# EAGLE design source_eagle (EAGLE 9.1.2)
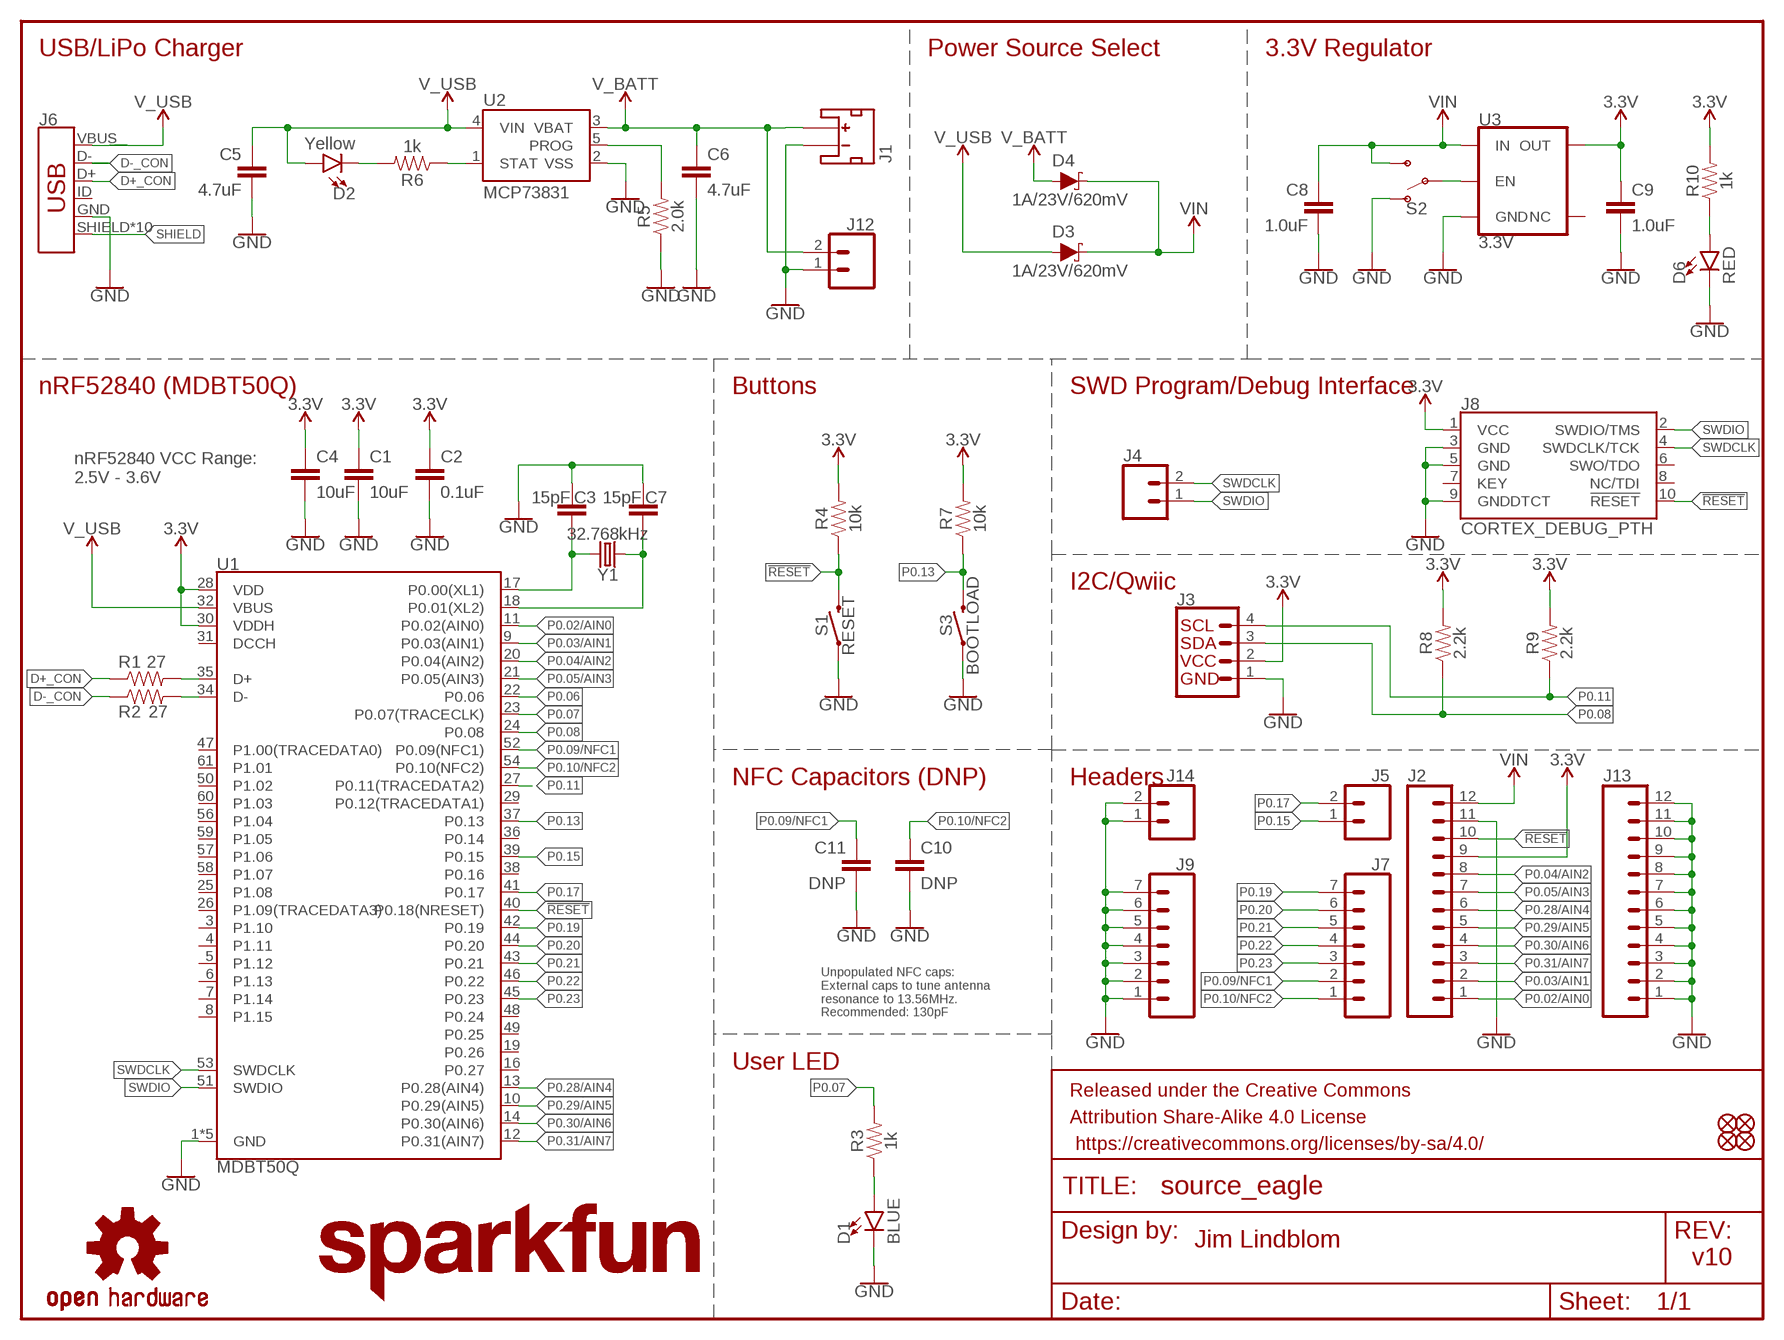
[diagram p0: schematic, sheet 1]

## Parts
C1  10uF  10UF-0603-6.3V-20%  [0603]
C2  0.1uF  0.1UF-0603-25V-(+80/-20%)  [0603]
C3  15pF  15PF-0603-50V-5%  [0603]
C4  10uF  10UF-0603-6.3V-20%  [0603]
C5  4.7uF  4.7UF-0603-6.3V-(10%)  [0603]
C6  4.7uF  4.7UF-0603-6.3V-(10%)  [0603]
C7  15pF  15PF-0603-50V-5%  [0603]
C8  1.0uF  1.0UF-0603-16V-10%  [0603]
C9  1.0uF  1.0UF-0603-16V-10%  [0603]
C10  DNP  270PF-0603-50V-5%  [0603]
C11  DNP  270PF-0603-50V-5%  [0603]
D1  BLUE  LED-BLUE0603  [LED-0603]
D2  Yellow  LED-YELLOW0603  [LED-0603]
D3  1A/23V/620mV  DIODE-SCHOTTKY-BAT20J  [SOD-323]
D4  1A/23V/620mV  DIODE-SCHOTTKY-BAT20J  [SOD-323]
D6  RED  LED-RED0603  [LED-0603]
FD1  FIDUCIALUFIDUCIAL  [FIDUCIAL-MICRO]
FD2  FIDUCIALUFIDUCIAL  [FIDUCIAL-MICRO]
FD3  FIDUCIALUFIDUCIAL  [FIDUCIAL-MICRO]
FD4  FIDUCIALUFIDUCIAL  [FIDUCIAL-MICRO]
FRAME1  FRAME-LETTER  [CREATIVE_COMMONS]
J1  JST_2MM_MALESMD  [JST-2-SMD]
J2  CONN_12NO_SILK  [1X12_NO_SILK]
J3  QWIIC_CONNECTORJS-1MM  [1X04_1MM_RA]
J4  CONN_021X02_NO_SILK  [1X02_NO_SILK]
J5  CONN_021X02_NO_SILK  [1X02_NO_SILK]
J6  USB_MICRO-B_HALF_PTH_MILL  [USB-MICROB-PTH-MILL]
J7  CONN_07NO_SILK  [1X07_NO_SILK]
J8  CORTEX_DEBUG_PTH  [2X5-PTH-1.27MM]
J9  CONN_07NO_SILK  [1X07_NO_SILK]
J12  CONN_021X02_NO_SILK  [1X02_NO_SILK]
J13  CONN_12NO_SILK  [1X12_NO_SILK]
J14  CONN_021X02_NO_SILK  [1X02_NO_SILK]
LOGO1  SFE_LOGO_NAME.2_INCH  [SFE_LOGO_NAME_.2]
LOGO2  OSHW-LOGOS  [OSHW-LOGO-S]
R1  27  27OHM-0603-1/10W-1%  [0603]
R2  27  27OHM-0603-1/10W-1%  [0603]
R3  1k  1KOHM-0603-1/10W-1%  [0603]
R4  10k  10KOHM-0603-1/10W-1%  [0603]
R5  2.0k  2.0KOHM-0603-1/10W-5%  [0603]
R6  1k  1KOHM-0603-1/10W-1%  [0603]
R7  10k  10KOHM-0603-1/10W-1%  [0603]
R8  2.2k  2.2KOHM-0603-1/10W-1%  [0603]
R9  2.2k  2.2KOHM-0603-1/10W-1%  [0603]
R10  1k  1KOHM-0603-1/10W-1%  [0603]
S1  RESET  MOMENTARY-SWITCH-SPST-SMD-RIGHT-ANGLE  [TACTILE_SWITCH_SMD_RIGHT_ANGLE]
S2  SWITCH-SPDT-SMD-RIGHT-ANGLE  [SWITCH_SPST_SMD_A]
S3  BOOTLOAD  MOMENTARY-SWITCH-SPST-SMD-RIGHT-ANGLE  [TACTILE_SWITCH_SMD_RIGHT_ANGLE]
U1  MDBT50Q  [MDBT50Q]
U2  MCP73831  [SOT23-5]
U3  3.3V  V_REG_AP2112K-3.3V  [SOT23-5]
Y1  32.768kHz  CRYSTAL-32.768KHZSMD-3.2X1.5  [CRYSTAL-SMD-3.2X1.5MM]

## Nets
3.3V [vcc]: C1.1 C2.1 C4.1 C9.1 J2.9 J3.2 J8.1(VCC) R4.2 R7.2 R8.2 R9.2 R10.2 U1.28(VDD) U1.30(VDDH) U3.5(OUT)
!RESET: J2.10 J8.10(!RESET) R4.1 S1.2 U1.40(P0.18(NRESET))
D+ [usb]: R1.2 U1.35(D+)
D+_CON [usb]: J6.D+ R1.1
D- [usb]: R2.2 U1.34(D-)
D-_CON [usb]: J6.D- R2.1
GND: C1.2 C2.2 C3.1 C4.2 C5.2 C6.2 C7.1 C8.2 C9.2 C10.2 C11.2 D1.C D6.C J1.1(-) J2.11 J3.1 J6.GND J8.3(GND) J8.5(GND) J8.9(GNDDTCT) J9.1 J9.2 J9.3 J9.4 J9.5 J9.6 J9.7 J12.1 J13.1 J13.2 J13.3 J13.4 J13.5 J13.6 J13.7 J13.8 J13.9 J13.10 J13.11 J13.12 J14.1 J14.2 R5.1 S1.1 S2.1(O) S3.1 U1.1(GND) U1.2(GND) U1.15(GND) U1.33(GND) U1.55(GND) U2.2(VSS) U3.2(GND)
N$1: R5.2 U2.5(PROG)
N$3: D2.C R6.2
N$4: R6.1 U2.1(STAT)
N$7: D1.A R3.1
N$10: D6.A R10.1
P0.02/AIN0: J2.1 U1.11(P0.02(AIN0))
P0.03/AIN1: J2.2 U1.9(P0.03(AIN1))
P0.04/AIN2: J2.8 U1.20(P0.04(AIN2))
P0.05/AIN3: J2.7 U1.21(P0.05(AIN3))
P0.06: U1.22(P0.06)
P0.07: R3.2 U1.23(P0.07(TRACECLK))
P0.08: J3.3 R8.1 U1.24(P0.08)
P0.09/NFC1: C11.1 J7.2 U1.52(P0.09(NFC1))
P0.10/NFC2: C10.1 J7.1 U1.54(P0.10(NFC2))
P0.11: J3.4 R9.1 U1.27(P0.11(TRACEDATA2))
P0.13: R7.1 S3.2 U1.37(P0.13)
P0.15: J5.1 U1.39(P0.15)
P0.17: J5.2 U1.41(P0.17)
P0.19: J7.7 U1.42(P0.19)
P0.20: J7.6 U1.44(P0.20)
P0.21: J7.5 U1.43(P0.21)
P0.22: J7.4 U1.46(P0.22)
P0.23: J7.3 U1.45(P0.23)
P0.28/AIN4: J2.6 U1.13(P0.28(AIN4))
P0.29/AIN5: J2.5 U1.10(P0.29(AIN5))
P0.30/AIN6: J2.4 U1.14(P0.30(AIN6))
P0.31/AIN7: J2.3 U1.12(P0.31(AIN7))
SHIELD: J6.SHIELD J6.SHIELD2(SHIELD) J6.SHIELD3(SHIELD) J6.SHIELD4(SHIELD) J6.SHIELD5(SHIELD) J6.SHIELD6(SHIELD) J6.SHIELD7(SHIELD) J6.SHIELD8(SHIELD) J6.SHIELD9(SHIELD) J6.SHIELD10(SHIELD)
SWDCLK: J4.2 J8.4(SWDCLK/TCK) U1.53(SWDCLK)
SWDIO: J4.1 J8.2(SWDIO/TMS) U1.51(SWDIO)
V_BATT: C6.1 D4.A J1.2(+) J12.2 U2.3(VBAT)
V_USB: C5.1 D2.A D3.A J6.VBUS U1.32(VBUS) U2.4(VIN)
VIN [vcc]: C8.1 D3.C D4.C J2.12 S2.3(S) U3.1(IN)
VREG_EN: S2.2(P) U3.3(EN)
XL1: C3.2 U1.17(P0.00(XL1)) Y1.P$2
XL2: C7.2 U1.18(P0.01(XL2)) Y1.P$1
Unconnected: J6.ID J8.6(SWO/TDO) J8.7(KEY) J8.8(NC/TDI) U1.3(P1.10) U1.4(P1.11) U1.5(P1.12) U1.6(P1.13) U1.7(P1.14) U1.8(P1.15) U1.16(P0.27) U1.19(P0.26) U1.25(P1.08) U1.26(P1.09(TRACEDATA3)) U1.29(P0.12(TRACEDATA1)) U1.31(DCCH) U1.36(P0.14) U1.38(P0.16) U1.47(P1.00(TRACEDATA0)) U1.48(P0.24) U1.49(P0.25) U1.50(P1.02) U1.56(P1.04) U1.57(P1.06) U1.58(P1.07) U1.59(P1.05) U1.60(P1.03) U1.61(P1.01) U3.4(NC)

## Notes on the sheet
- USB/LiPo Charger | Power Source Select | 3.3V Regulator
- nRF52840 (MDBT50Q) | Buttons | SWD Program/Debug Interface
- nRF52840 VCC Range:
  2.5V - 3.6V
- I2C/Qwiic
- NFC Capacitors (DNP) | Headers
- Unpopulated NFC caps:
  External caps to tune antenna 
  resonance to 13.56MHz.
  Recommended: 130pF
- User LED
- Jim Lindblom
- v10

## Library data of the parts
C1 C4 = SparkFun-Capacitors:10UF: 10.0µF ceramic capacitors A capacitor is a passive two-terminal electrical component used to store electrical energy temporarily in an electric field.; PROD_ID: CAP-11015
C2 = SparkFun-Capacitors:0.1UF: 0.1µF ceramic capacitors A capacitor is a passive two-terminal electrical component used to store electrical energy temporarily in an electric field.; PROD_ID: CAP-00810
C3 C7 = SparkFun-Capacitors:15PF: 15pF ceramic capacitors A capacitor is a passive two-terminal electrical component used to store electrical energy temporarily in an electric field.; PROD_ID: CAP-07881
C5 C6 = SparkFun-Capacitors:4.7UF: 4.7µF ceramic capacitors A capacitor is a passive two-terminal electrical component used to store electrical energy temporarily in an electric field.; PROD_ID: CAP-08280
C8 C9 = SparkFun-Capacitors:1.0UF: 1µF ceramic capacitors A capacitor is a passive two-terminal electrical component used to store electrical energy temporarily in an electric field.; PROD_ID: CAP-00868
C10 C11 = SparkFun-Capacitors:270PF: 270pF/0.27nF ceramic capacitors A capacitor is a passive two-terminal electrical component used to store electrical energy temporarily in an electric field.; PROD_ID: CAP-13339; VALUE: 270PF
D1 = SparkFun-LED:LED-BLUE: Blue SMD LED Used in manufacturing of various products at SparkFun Packages: 0603 - SMD 0603 package [Product Link] <http://www.digikey.com/product-detail/en/SMLE12BC7TT86/511-1589-2-ND/1641808> 1206 - SMD1206 package [Product Link] <http://www.digikey.com/product-detail/en/lite-on-inc/LTST-C150TBKT/160-1643-1-ND/573584> SparkFun Products: ESP8266 Thing-Dev Board <https://www.sparkfun.com/products/13711> RedBoard <https://www.sparkfun.com/products/12757>; PROD_ID: DIO-08575
D2 = SparkFun-LED:LED-YELLOW: Yellow SMD LED Used in manufacturing several products at SparkFun. Packages: 0603 - SMD 0603 package[Product Link] <http://www.kingbrightusa.com/product.asp?catalog_name=LED&product_id=APT1608SYCK> 0603 -SMART - SMART SMD 0603 package (more efficient/more expensive) [Product Link] <http://www.osram-os.com/osram_os/en/products/product-catalog/led-light-emitting-diodes/smartled-0603/ly-l29k/index.jsp> LilyPad - SMD1206 package[Product Datasheet] <https://www.sparkfun.com/datasheets/DevTools/LilyPad/Q150YUS4.pdf> SparkFun Products: Blynk Board <https://www.sparkfun.com/products/13794> IOIO-OTG <https://www.sparkfun.com/products/13613> XBee Explorer Serial <https://www.sparkfun.com/products/13225>; PROD_ID: DIO-09003
D3 D4 = SparkFun-DiscreteSemi:DIODE-SCHOTTKY: Schottky diode A Schottky diode is a semiconductor diode which has a low forward voltage drop and a very fast switching action.; PROD_ID: DIO-11623
D6 = SparkFun-LED:LED-RED: Red SMD LED Used in manufacturing of most products at SparkFun Packages: 0603 - SMD 0603 package [Product Link] <http://docs.avagotech.com/docs/AV02-0551EN> 0603 SMART - SMD 0603 SMART package ( more efficient and expensive)[Product Link] <http://www.osram-os.com/Graphics/XPic2/00077099_0.pdf> 1206 - SMD1206 package [Product Link] <https://www.sparkfun.com/datasheets/DevTools/LilyPad/Q150OVS4.pdff> SparkFun Products: Pro Mini 328 -5V <https://www.sparkfun.com/products/821> RedBoard <https://www.sparkfun.com/products/12757> IOIO-OTG <https://www.sparkfun.com/products/13613>; PROD_ID: DIO-00819
FD1-FD4 = SparkFun-Aesthetics:FIDUCIAL: Fiducial Alignment Points Point-of-reference for pick-and-place machines and other optical instruments.
FRAME1 = SparkFun-Aesthetics:FRAME-LETTER: Schematic Frame - Letter Standard 8.5x11 US Letter frame
J1 = SparkFun-Connectors:JST_2MM_MALE: JST 2MM MALE RA CONNECTOR Two pin, compact surface mount connector. Commonly used as a battery input connection point. We really like the solid locking feeling and high current rating on these small connectors. We use these all the time as battery connectors. Mates to single-cell LiPo batteries. Here is the connector we sell at SparkFun: JST Right Angle Connector - White (PRT-08612) Datasheet It was used on these SparkFun products: SparkFun MOSFET Power Controller (PRT-11214) SparkFun Battery Babysitter - LiPo Battery Manager (PRT-13777) And many, many others that required a lipo battery connection.; PROD_ID: CONN-11443; SF_ID: PRT-08612
J2 J13 = SparkFun-Connectors:CONN_12: Multi connection point. Often used as Generic Header-pin footprint for 0.1 inch spaced/style header connections On any of the 0.1 inch spaced packages, you can populate with these: Break Away Headers - Straight (PRT-00116) Break Away Male Headers - Right Angle (PRT-00553) Female Headers (PRT-00115) Break Away Headers - Machine Pin (PRT-00117) Break Away Female Headers - Swiss Machine Pin (PRT-00743) For SCREWTERMINALS and SPRING TERMINALS visit here: Screw Terimnals on SparkFun.com (5mm/3.5mm/2.54mm spacing) This device is also useful as a general connection point to wire up your design to another part of your project. Our various solder wires solder well into these plated through hole pads. Hook-Up Wire - Assortment (Stranded, 22 AWG) (PRT-11375) Hook-Up Wire - Assortment (Solid Core, 22 AWG) (PRT-11367) View the entire wire category on our website here Special notes: Molex polarized connector foot print use with SKU : PRT-08231 with associated crimp pins and housings. 1MM SMD Version SKU: PRT-10208 NOTES ON THE VARIANTS LOCK and LOCK_LONGPADS... This footprint was designed to help hold the alignment of a through-hole component (i.e. 6-pin header) while soldering it into place. You may notice that each hole has been shifted either up or down by 0.005 of an inch from it's more standard position (which is a perfectly straight line). This slight alteration caused the pins (the squares in the middle) to touch the edges of the holes. Because they are alternating, it causes a "brace" to hold the component in place. 0.005 has proven to be the perfect amount of "off-center" position when using our standard breakaway headers. Although looks a little odd when you look at the bare footprint, once you have a header in there, the alteration is very hard to notice. Also,if you push a header all the way into place, it is covered up entirely on the bottom side.
J3 = SparkFun-Connectors:QWIIC_CONNECTOR: SparkFun I2C Standard Qwiic Connector An SMD 1mm pitch JST connector makes it easy and quick (get it? Qwiic?) to connect I2C devices to each other. The Qwiic system <http://www.sparkfun.com/qwiic> enables fast and solderless connection between popular platforms and various sensors and actuators. We carry 200mm <https://www.sparkfun.com/products/14204>, 100mm <https://www.sparkfun.com/products/14205>, 50mm <https://www.sparkfun.com/products/14206>, and breadboard friendly <https://www.sparkfun.com/products/14207> Qwiic cables. We also offer 10 pcs strips <https://www.sparkfun.com/products/14323> the SMD connectors.; PROD_ID: CONN-13694
J4 J5 J12 J14 = SparkFun-Connectors:CONN_02: Multi connection point. Often used as Generic Header-pin footprint for 0.1 inch spaced/style header connections On any of the 0.1 inch spaced packages, you can populate with these: Break Away Headers - Straight (PRT-00116) Break Away Male Headers - Right Angle (PRT-00553) Female Headers (PRT-00115) Break Away Headers - Machine Pin (PRT-00117) Break Away Female Headers - Swiss Machine Pin (PRT-00743) For SCREWTERMINALS and SPRING TERMINALS visit here: Screw Terimnals on SparkFun.com (5mm/3.5mm/2.54mm spacing) This device is also useful as a general connection point to wire up your design to another part of your project. Our various solder wires solder well into these plated through hole pads. Hook-Up Wire - Assortment (Stranded, 22 AWG) (PRT-11375) Hook-Up Wire - Assortment (Solid Core, 22 AWG) (PRT-11367) View the entire wire category on our website here Special notes: Molex polarized connector foot print use with: PRT-08233 with associated crimp pins and housings. 2.54_SCREWTERM for use with PRT-10571. 3.5mm Screw Terminal footprints for PRT-08084 5mm Screw Terminal footprints for use with PRT-08432
J6 = SparkFun-Connectors:USB_MICRO-B: USB Type Micro-B Connector Male/female and PTH/SMT variants SparkFun Products: SparkFun microB USB Breakout <https://www.sparkfun.com/products/12035> SparkFun USB microB Plug Breakout <https://www.sparkfun.com/products/10031> SparkFun ESP8266 Thing <https://www.sparkfun.com/products/13231>; PROD_ID: CONN-13711
J7 J9 = SparkFun-Connectors:CONN_07: Multi connection point. Often used as Generic Header-pin footprint for 0.1 inch spaced/style header connections On any of the 0.1 inch spaced packages, you can populate with these: Break Away Headers - Straight (PRT-00116) Break Away Male Headers - Right Angle (PRT-00553) Female Headers (PRT-00115) Break Away Headers - Machine Pin (PRT-00117) Break Away Female Headers - Swiss Machine Pin (PRT-00743) For SCREWTERMINALS and SPRING TERMINALS visit here: Screw Terimnals on SparkFun.com (5mm/3.5mm/2.54mm spacing) This device is also useful as a general connection point to wire up your design to another part of your project. Our various solder wires solder well into these plated through hole pads. Hook-Up Wire - Assortment (Stranded, 22 AWG) (PRT-11375) Hook-Up Wire - Assortment (Solid Core, 22 AWG) (PRT-11367) View the entire wire category on our website here Special notes: Molex polarized connector foot print use with SKU : PRT-08231 with associated crimp pins and housings. 1MM SMD Version SKU: PRT-10208 NOTES ON THE VARIANTS LOCK and LOCK_LONGPADS... This footprint was designed to help hold the alignment of a through-hole component (i.e. 6-pin header) while soldering it into place. You may notice that each hole has been shifted either up or down by 0.005 of an inch from it's more standard position (which is a perfectly straight line). This slight alteration caused the pins (the squares in the middle) to touch the edges of the holes. Because they are alternating, it causes a "brace" to hold the component in place. 0.005 has proven to be the perfect amount of "off-center" position when using our standard breakaway headers. Although looks a little odd when you look at the bare footprint, once you have a header in there, the alteration is very hard to notice. Also,if you push a header all the way into place, it is covered up entirely on the bottom side.
J8 = SparkFun-Connectors:CORTEX_DEBUG: Cortex Debug Connector - 10 pin Supports JTAG debug, Serial Wire debug, and Serial Wire Viewer. PTH and SMD connector options available. General Connector Information <http://infocenter.arm.com/help/topic/com.arm.doc.faqs/attached/13634/cortex_debug_connectors.pdf> Products: PTH Connector <http://www.digikey.com/product-detail/en/cnc-tech/3220-10-0100-00/1175-1627-ND/3883661> -via Digi-Key SparkFun PSoc <https://www.sparkfun.com/products/13229> SparkFun T <https://www.sparkfun.com/products/13810>
LOGO1 = SparkFun-Aesthetics:SFE_LOGO_NAME: SparkFun Font Logo This is the SparkFun name logo. The logo on the schematic will always be the same size; the package variant is the height of the flame part of the logo (or the height the flame would be, if it were drawn). Default layer for the logo on the board is tSilk.
LOGO2 = SparkFun-Aesthetics:OSHW-LOGO: Open-Source Hardware (OSHW) Logo This logo indicates the piece of hardware it is found on incorporates a OSHW license and/or adheres to the definition of open source hardware found here: http://freedomdefined.org/OSHW
R1 R2 = SparkFun-Resistors:27OHM: 27Ω resistor A resistor is a passive two-terminal electrical component that implements electrical resistance as a circuit element. Resistors act to reduce current flow, and, at the same time, act to lower voltage levels within circuits. - Wikipedia; PROD_ID: RES-09334
R3 R6 R10 = SparkFun-Resistors:1KOHM: 1kΩ resistor A resistor is a passive two-terminal electrical component that implements electrical resistance as a circuit element. Resistors act to reduce current flow, and, at the same time, act to lower voltage levels within circuits. - Wikipedia; PROD_ID: RES-07856
R4 R7 = SparkFun-Resistors:10KOHM: 10kΩ resistor A resistor is a passive two-terminal electrical component that implements electrical resistance as a circuit element. Resistors act to reduce current flow, and, at the same time, act to lower voltage levels within circuits. - Wikipedia; PROD_ID: RES-00824
R5 = SparkFun-Resistors:2.0KOHM: 2kΩ resistor A resistor is a passive two-terminal electrical component that implements electrical resistance as a circuit element. Resistors act to reduce current flow, and, at the same time, act to lower voltage levels within circuits. - Wikipedia; PROD_ID: RES-08296
R8 R9 = SparkFun-Resistors:2.2KOHM: 2.2kΩ resistor A resistor is a passive two-terminal electrical component that implements electrical resistance as a circuit element. Resistors act to reduce current flow, and, at the same time, act to lower voltage levels within circuits. - Wikipedia; PROD_ID: RES-08272
S1 S3 = SparkFun-Switches:MOMENTARY-SWITCH-SPST: Momentary Switch (Pushbutton) - SPST Normally-open (NO) SPST momentary switches (buttons, pushbuttons). Variants PTH-12MM - 12mm square, through-hole Momentary Pushbutton Switch - 12mm Square (COM-09190) PTH-6.0MM, PTH-6.0MM-KIT - 6.0mm square, through-hole Mini Pushbutton Switch (COM-00097) KIT package intended for soldering kit's - only one side of pads' copper is exposed. PTH-RIGHT-ANGLE-KIT - Right-angle, through-hole Right Angle Tactile Button - Used on SparkFun BigTime Watch Kit SMD-12MM - 12mm square, surface-mount Tactile Button - SMD (12mm) (COM-12993) Used on SparkFun PicoBoard SMD-4.5MM - 4.5mm Square Trackball Switch Used on SparkFun Blackberry Trackballer Breakout SMD-4.6MMX2.8MM - 4.60mm x 2.80mm, surface mount Used on SparkFun SAMD21 Mini Breakout SMD-5.2MM, SMD-5.2-REDUNDANT - 5.2mm square, surface-mount Mini Pushbutton Switch - SMD (COM-08720) Used on Arduino Pro Mini REDUNDANT package connects both switch circuits together SMD-6.0X3.5MM - 6.0 x 3.5mm, surface mount Momentary Reset Switch SMD (COM-08229) SMD-6.2MM-TALL - 6.2mm square, surface mount Tactile Button - SMD (6mm) Used on SparkFun Digital Sandbox SMD-RIGHT-ANGLE - Right-angle, surface mount Used on SparkFun Block for Intel® Edison - Arduino; PROD_ID: COMP-12265
S2 = SparkFun-Switches:SWITCH-SPDT: Single Pole, Double Throw (SPDT) Switch Single-pole, double-throw (SPDT) switch. Variant Overview SMD-AYZ0202 Surface Mount DPDT Switch (COM-00597) Used on e.g. LilyPad Arduino USB - ATmega32U4 Board PTH-11.6X4.0MM SPDT Mini Power Switch (COM-00102) Used on e.g. SparkFun Simon Says - Through-Hole Soldering Kit (KIT-10547) PTH-11.6X4.0MM-KIT KIT version of SPDT Mini Power Switch - Simplifies soldering by removing tStop of switch pins - only one side can be soldered. PTH-11.6X4.0MM-LOCK LOCK version of SPDT Mini Power Switch - Offset pins hold switch in place for easier soldering. SMD-RIGHT-ANGLE Surface Mount Right Angle Switch (COM-10860) Used on e.g. SparkFun ESP8266 Thing; PROD_ID: SWCH-10651; SF_SKU: COM-10860
U1 = nrf52840:MDBT50Q; PROD_ID: IC-14109
U2 = SparkFun-IC-Power:MCP73831: MCP73831T Li-Ion, Li-Pol Controller Miniature single cell, fully integrated Li-Ion, Li-polymer charge management controller Datasheet <http://ww1.microchip.com/downloads/en/DeviceDoc/20001984g.pdf> SparkFun Products: SparkFun ESP32 Thing <https://www.sparkfun.com/products/13907> SparkFun 9DoF Razor IMU M0 <https://www.sparkfun.com/products/14001>; PROD_ID: IC-09995
U3 = SparkFun-IC-Power:V_REG_AP2112: AP2112 - 600mA CMOS LDO Regulator w/ Enable The AP2112 is CMOS process low dropout linear regulator with enable function, the regulator delivers a guaranteed 600mA (min.) continuous load current. Features Output Voltage Accuracy: ±1.5% Output Current: 600mA (Min.) Foldback Short Current Protection: 50mA Enable Function to Turn ON/OFF VOUT Low Dropout Voltage (3.3V): 250mV (Typ.) @IOUT=600mA Excellent Load Regulation: 0.2%/A (Typ.) Excellent Line Regulation: 0.02%/V (Typ.) Low Quiescent Current: 55μA (Typ.) Low Standby Current: 0.01μA (Typ.) Low Output Noise: 50μVRMS PSRR: 100Hz -65dB, 1kHz -65dB OTSD Protection Stable with 1.0μF Flexible Cap: Ceramic, Tantalum and Aluminum Electrolytic Operation Temperature Range: -40°C to 85°C ESD: MM 400V, HBM 4000V; PROD_ID: VREG-12457
Y1 = SparkFun-Clocks:CRYSTAL-32.768KHZ: 32.768kHz Crystal Frequency: 32.768kHz Frequency Stability: ±20ppm Load Capacitance: 12.5pF (PTH-2X6 & SMD-3.2X1.5), 6pF (SMD-2X6) SparkFun Products: SparkFun BigTime Watch Kit <https://www.sparkfun.com/products/11734> SparkFun nRF52832 Breakout <https://www.sparkfun.com/products/13990> SparkFun Real Time Clock Module <https://www.sparkfun.com/products/12708>; PROD_ID: XTAL-13062

## Net classes
0 default: width 0 mm, drill 0 mm
1 vcc: width 0 mm
2 usb: width 0.254 mm, drill 0.305 mm, clearance 0.254 mm

## Board
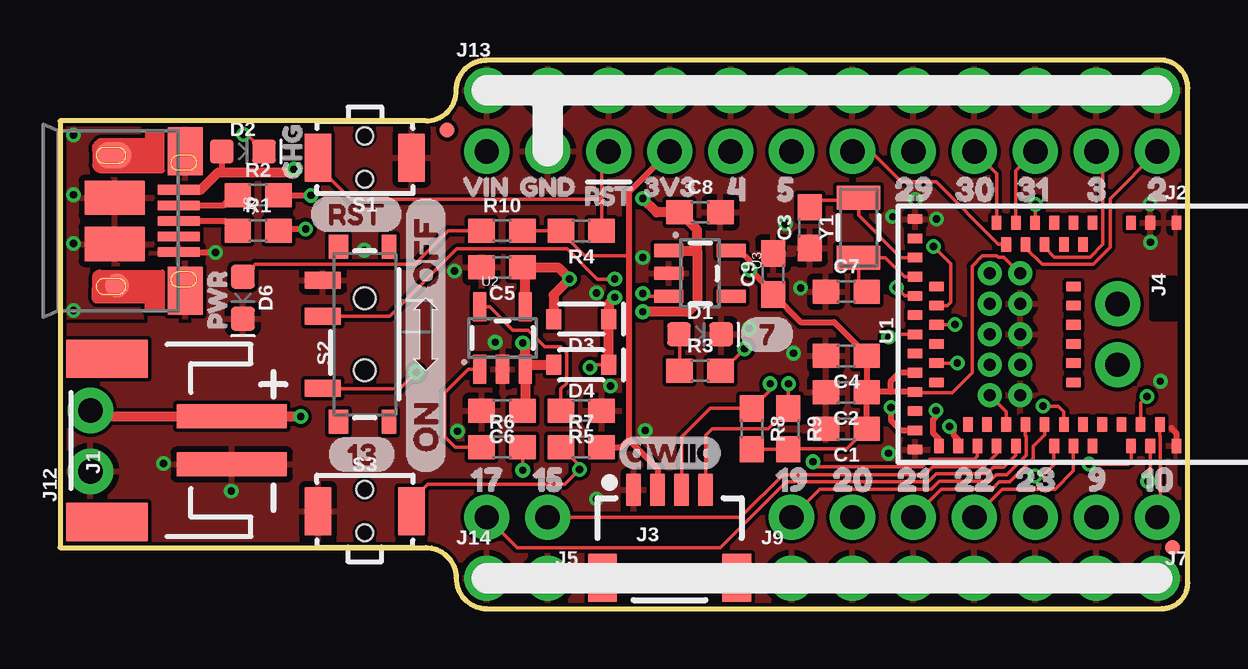
[diagram p1: board, top side]
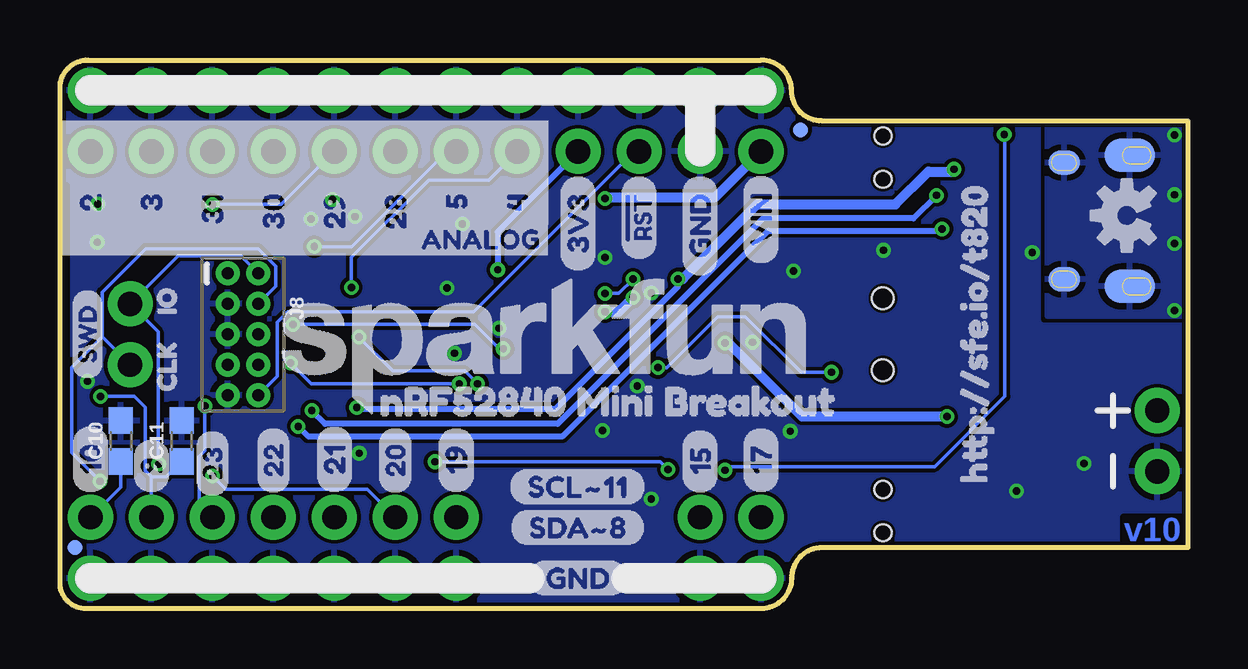
[diagram p2: board, bottom side, seen from below]

Size 46.99 x 22.86 mm. Coordinates in mm from the lower left corner, seen from the top.
Outline: 0,2.54 15.24,2.54 arc-90 16.51,1.27 arc90 17.78,0 45.91,0 arc90 46.99,1.07 46.99,21.7 arc90 45.83,22.86 17.78,22.86 arc90 16.51,21.59 arc-90 15.24,20.32 0,20.32 0,2.54
Copper layers (1*16): Top 0.035mm / dielectric 1.5mm / Bottom 0.035mm
Design rules "SparkFun-2-layer-PCBWay-LIMIT": minimum track width 6mil, minimum drill 0.3mm, track to track 6mil, track to pad 6mil, pad to pad 6mil, via to via 6mil, smd to smd 6mil, copper to edge 6mil, drill to drill 6mil, minimum pad ring 6mil, minimum via ring 6mil, stop-mask expansion 4mil, vias tented up to drill 25mil, thermal gap 10mil

### Footprints (pad centres in the part's own frame; a part is rotated, then mirrored left to right if it is on the bottom)
0603 = smd 1.1 x 1: 1 -0.85,0; 2 0.85,0
LED-0603 = smd 1 x 1: A -0.877,0; C 0.877,0
SOD-323 = smd 0.63 x 0.83: A 1.15,0; C -1.15,0
FIDUCIAL-MICRO = smd 0.635 x 0.635: 1 0,0
JST-2-SMD = smd 1 x 4.6: 1 -1,-3.7; 2 1,-3.7 | smd 1.6 x 3.4: NC1 -3.4,1.5; NC2 3.4,1.5
1X12_NO_SILK = drill 1.016 pad 1.88: 1 0,0; 2 2.54,0; 3 5.08,0; 4 7.62,0; 5 10.16,0; 6 12.7,0; 7 15.24,0; 8 17.78,0; 9 20.32,0; 10 22.86,0; 11 25.4,0; 12 27.94,0
1X04_1MM_RA = smd 0.6 x 1.35: 1 -1.5,0; 2 -0.5,0; 3 0.5,0; 4 1.5,0 | smd 1.2 x 2: NC1 2.8,-3.675; NC2 -2.8,-3.675
1X02_NO_SILK = drill 1.016 pad 1.88: 1 0,0; 2 2.54,0
USB-MICROB-PTH-MILL = smd 0.4 x 1.75: D+ 0,0; D- -0.65,0; GND 1.3,0; ID 0.65,0; VBUS -1.3,0 | smd 2 x 1.46: SHIELD -2.9,0.275; SHIELD2 2.9,0.275 | smd 1.425 x 2.5: SHIELD3 -0.963,-2.675; SHIELD4 0.963,-2.675 | smd 1.4 x 2.1 bottom: SHIELD5 -2.731,-2.531; SHIELD7 2.729,-2.531 | smd 1 x 1: SHIELD6 2.7,-2.575 | smd 1.1 x 1.5: SHIELD8 -2.731,-2.731 | smd 1 x 1.3 bottom: SHIELD9 -2.43,0.195; SHIELD10 2.43,0.195
1X07_NO_SILK = drill 1.016 pad 1.88: 1 0,0; 2 2.54,0; 3 5.08,0; 4 7.62,0; 5 10.16,0; 6 12.7,0; 7 15.24,0
2X5-PTH-1.27MM = drill 0.508 pad 1: 1 -2.54,-0.635; 2 -2.54,0.635; 3 -1.27,-0.635; 4 -1.27,0.635; 5 0,-0.635; 6 0,0.635; 7 1.27,-0.635; 8 1.27,0.635; 9 2.54,-0.635; 10 2.54,0.635
TACTILE_SWITCH_SMD_RIGHT_ANGLE = smd 1.1 x 2: 1 -1.95,0; 2 1.95,0 | hole 0.7: 0,0.9; 0,-0.9
SWITCH_SPST_SMD_A = smd 0.7 x 1.5: 1 -2.25,-1.75; 2 -0.75,-1.75; 3 2.25,-1.75 | smd 1 x 0.6: GND1 -3.65,1; GND3 3.65,1 | smd 1 x 0.8: GND2 -3.65,-1.1; GND4 3.65,-1.1 | hole 0.9: -1.5,0; 1.5,0
MDBT50Q = smd 0.6 x 0.4: 1 -4.65,3.65; 2 -4.65,2.55; 3 -4.65,1.75; 4 -4.65,0.15; 5 -3.75,-0.25; 6 -4.65,-0.65; 7 -3.75,-1.05; 8 -4.65,-1.45; 9 -3.75,-1.85; 10 -4.65,-2.25; 11 -3.75,-2.65; 12 -4.65,-3.05; 13 -3.75,-3.45; 14 -4.65,-3.85; 34 4.65,-6.25; 35 4.65,-5.45; 36 3.75,-5.05; 37 4.65,-4.65; 38 3.75,-4.25; 39 4.65,-3.85; 40 3.75,-3.45; 41 4.65,-3.05; 42 3.75,-2.65; 43 3.75,-1.85; 44 4.65,-1.45; 45 3.75,-1.05; 46 4.65,-0.65; 47 3.75,-0.25; 48 4.65,0.15; 49 3.75,0.55; 50 3.75,1.35; 51 4.65,1.75; 52 3.75,2.15; 53 4.65,2.55; 54 3.75,2.95; 55 4.65,3.65 | smd 0.4 x 0.6: 15 -4.8,-7.25; 16 -4,-7.25; 17 -3.2,-7.25; 18 -2.4,-7.25; 19 -2,-6.35; 20 -1.6,-7.25; 21 -1.2,-6.35; 22 -0.8,-7.25; 23 -0.4,-6.35; 24 0,-7.25; 25 0.4,-6.35; 26 0.8,-7.25; 27 1.2,-6.35; 28 1.6,-7.25; 29 2,-6.35; 30 2.4,-7.25; 31 3.2,-7.25; 32 4,-7.25; 33 4.8,-7.25; 56 -2,-0.65; 57 -1.2,-0.65; 58 -0.4,-0.65; 59 0.4,-0.65; 60 1.2,-0.65; 61 2,-0.65
SOT23-5 = smd 0.55 x 1.2: 1 -0.95,-1.3; 2 0,-1.3; 3 0.95,-1.3; 4 0.95,1.3; 5 -0.95,1.3
CRYSTAL-SMD-3.2X1.5MM = smd 1 x 1.8: P$1 -1.25,0; P$2 1.25,0

### Placement (x,y rotation side)
C1  32.77,7.49 180 top
C2  32.77,9.02 180 top
C3  31.24,15.88 90 top
C4  32.77,10.54 180 top
C5  18.41,14.22 180 top
C6  18.41,8.26 180 top
C7  32.77,13.21 0 top
C8  26.67,16.51 0 top
C9  29.72,13.94 90 top
C10  44.45,6.99 90 bottom
C11  41.91,6.99 90 bottom
D1  26.67,11.43 0 top
D2  7.62,19.05 0 top
D3  21.72,12.06 180 top
D4  21.72,10.16 180 top
D6  7.62,12.95 270 top
FD1  16.13,19.94 0 top
FD2  46.35,2.54 0 top
FD3  46.35,2.54 0 bottom
FD4  16.13,19.94 0 bottom
FRAME1  not placed on the board
J1  3.45,7.01 90 top
J2  45.72,19.05 180 top
J3  25.4,4.95 0 top
J4  44.07,12.7 270 top
J5  20.32,3.81 180 top
J6  4.95,16.15 270 top
J7  45.72,3.81 180 top
J8  39.37,11.43 270 bottom
J9  30.48,1.27 0 top
J12  1.27,5.71 90 top
J13  17.78,21.59 0 top
J14  17.78,1.27 0 top
LOGO1  37.72,8.13 0 bottom
LOGO2  2.54,16.38 90 bottom
R1  8.26,15.75 0 top
R2  8.26,17.22 0 top
R3  26.67,9.91 0 top
R4  21.72,15.75 180 top
R5  21.72,8.26 180 top
R6  18.41,6.73 0 top
R7  21.72,6.73 0 top
R8  28.83,7.49 270 top
R9  30.35,7.49 270 top
R10  18.41,15.75 0 top
S1  12.7,18.8 180 top
S2  12.7,11.43 270 top
S3  12.7,4.06 0 top
U1  42.88,11.43 270 top
U2  18.44,11.28 0 top
U3  26.67,13.97 270 top
U$1  [3V316]  23.65,17.58 0 top
U$2  [130]  11.15,6.43 0 top
U$3  [RST19]  21.16,17.2 0 top
U$4  [ON1]  15.24,5.59 90 top
U$5  [CHG26]  9.68,17.22 90 top
U$6  [PWR27]  6.55,10.97 90 top
U$7  [GND17]  18.49,17.58 0 top
U$8  [QWIIC#LOGO#JPG]  25.4,6.5 0 top
U$9  [20]  45.72,15.75 90 bottom
U$10  [31]  43.18,15.75 90 bottom
U$11  [292]  35.56,15.01 90 bottom
U$12  [313]  40.64,15.21 90 bottom
U$13  [3V30]  25.4,14 90 bottom
U$14  [285]  33.02,15.01 90 bottom
U$15  [521]  30.48,15.82 90 bottom
U$16  [421]  27.94,15.75 90 bottom
U$17  [HTTP###SFE#IO#T8200]  8.89,4.32 90 bottom
U$18  [#RST6]  22.86,14.38 90 bottom
U$19  [GND7]  20.32,13.69 90 bottom
U$20  [VIN8]  17.78,14.3 90 bottom
U$21  [1022]  45.72,4.8 90 bottom
U$22  [916]  43.18,4.8 90 bottom
U$23  [2111]  35.56,4.62 90 bottom
U$24  [1912]  30.48,4.8 90 bottom
U$25  [1713]  17.78,4.8 90 bottom
U$26  [1522]  20.32,4.75 90 bottom
U$27  [VIN19]  16.1,17.58 0 top
U$28  [70]  28.32,11.43 0 top
U$29  [NRF52840_MINI_BREAKOUT0]  34.65,8.64 0 bottom
U$30  [GND6]  27.53,1.27 0 bottom
U$31  [27]  44.32,17.48 0 top
U$32  [36]  41.78,17.48 0 top
U$33  [SWD0]  45.85,9.53 90 bottom
U$34  [315]  39.01,17.48 0 top
U$35  [300]  38.1,14.99 90 bottom
U$36  [301]  36.45,17.48 0 top
U$37  [293]  33.93,17.48 0 top
U$38  [108]  44.2,5.38 0 top
U$39  [51]  28.85,17.48 0 top
U$40  [40]  26.8,17.48 0 top
U$41  [97]  41.99,5.38 0 top
U$42  [236]  38.99,5.38 0 top
U$43  [200]  33.02,4.75 90 bottom
U$44  [225]  36.42,5.38 0 top
U$45  [221]  38.1,4.62 90 bottom
U$46  [214]  34.04,5.38 0 top
U$47  [203]  31.37,5.38 0 top
U$48  [192]  29.01,5.38 0 top
U$49  [151]  18.69,5.38 0 top
U$50  [170]  16.29,5.38 0 top
U$51  [RST1]  10.36,16.43 0 top
U$52  [ANALOG2]  32.69,15.39 0 bottom
U$53  [232]  40.64,4.62 90 bottom
U$54  [SCL#114]  28.32,5.08 0 bottom
U$55  [SDA#83]  28.24,3.38 0 bottom
U$56  [IO2]  42.55,11.56 90 bottom
U$57  [CLK1]  42.55,8.38 90 bottom
U$58  [OFF2]  15.24,12.45 90 top
Y1  33.27,15.88 90 top

### Tracks (layer width: path | path; a pad name or v marks a point on that pad's centre or on a via)
3.3V  (via drill 0.3)
  Top 0.152: J8.1 39.32,14.65 39.08,14.65 39.04,14.7 38.43,14.7 38.01,14.27 38.01,9.83 37.17,9 35.65,9 U1.30 | 23.7,14.71 21.86,14.71 20.87,15.7 R4.2 R10.2 | R8.2 R9.2 30.36,6.66 32.78,6.66 C1.1
  Top 0.254: U3.5 28.31,14.92 28.75,14.48 v28.75,14.12 29.72,13.16 C9.1 30.88,11.94 32.26,11.94 33.62,10.58 C4.1 C2.1 | C1.1 C2.1 | U1.30 34.59,9.03 | 34.59,9.03 C2.1 | U1.28 34.98,9.83 34.59,9.45 34.59,9.03 | J2.9 23.7,17.35 23.7,14.71 23.7,7.04 | J3.2 24.9,5.83 23.7,7.04 | R7.2 23.39,6.73 23.7,7.04
  Bottom 0.254: J2.9 28.75,15.7 v28.75,14.12
!RESET
  Top 0.152: U1.40 39.42,8.2 J8.10 | R4.1 22.57,17.04 | 22.57,17.04 22.57,18.76 J2.10 | 22.57,17.04 22.55,17.06 12.11,17.06 10.75,18.41 S1.2
  Bottom 0.152: J2.10 23.07,19.05 29.75,12.37 37.51,12.37 37.95,11.93 37.95,9.68 J8.10
D+  (via drill 0.3)
  Top 0.254: v10.24,15.82 9.18,15.82 R1.2 | U1.35 37.42,7.04 37.24,7.22 37.24,7.42 v37.07,7.59
  Bottom 0.254: v37.07,7.59 36.66,7.19 26.04,7.19 17.48,15.75 10.3,15.75 10.24,15.81 v10.24,15.82
D+_CON
  Top 0.254: J6.D+ 6.87,16.15 7.28,15.75 R1.1
D-  (via drill 0.3)
  Top 0.254: R2.2 v10.46,17.22 | U1.34 36.62,7.07 36.38,7.31 36.38,7.88 36.5,8 v36.5,8.25 v36.5,8.26
  Bottom 0.254: v36.5,8.26 35.94,7.7 26.25,7.7 17.69,16.26 11.43,16.26 v10.46,17.22
D-_CON
  Top 0.254: J6.D- 6.81,16.8 7.23,17.22 R2.1
GND  (via drill 0.3)
  Top 0.254: U1.55 46.52,7.3 46.3,7.52 | v6.48,14.83 4.97,14.83 J6.GND
  other vias: 18.14,11.1 16.56,7.39 16.43,14.07 4.32,6.05 7.14,4.9 22.35,4.57 28.7,11.68 24.28,14.63 30.23,16.03 30.86,13.36 36.53,16.23 34.7,16.33 35.64,17.04 45.44,15.27 45.42,16.87 45.85,9.47 12.67,14.94 34.52,6.48 22.94,9.27 24.38,7.42 30.56,10.64 22.35,13.16
  pour Top (isolate 0.152, rank 6): 0,2.54 15.24,2.54 arc-90 16.51,1.27 arc90 17.78,0 46.99,0 46.99,22.86 17.78,22.86 arc90 16.51,21.59 arc-90 15.24,20.32 0,20.32
  pour Bottom (isolate 0.152, rank 6): 0,2.54 15.24,2.54 arc-90 16.51,1.27 arc90 17.78,0 46.99,0 46.99,22.86 17.78,22.86 arc90 16.51,21.59 arc-90 15.24,20.32 0,20.32
N$1
  Top 0.152: U2.5 17.91,12.57 18.87,11.61 19.51,11.61 20.2,10.91 20.87,10.91 21.11,10.67 21.11,9.4 20.87,9.15 R5.2
N$3  (via drill 0.3)
  Top 0.152: v19.28,5.77 19.28,6.72 R6.2 | v7.64,19.76 7.79,19.76 D2.C
  Bottom 0.152: v19.28,5.77 19.13,5.92 10.54,5.92 7.62,8.84 7.62,19.74 v7.64,19.76
N$4
  Top 0.152: U2.1 17.01,9.98 16.03,8.99 16.03,7.17 16.47,6.73 R6.1
N$7
  Top 0.152: R3.1 25.82,11.4 D1.A
N$10
  Top 0.152: R10.1 16.18,15.75 14.78,14.35 8.14,14.35 D6.A
P0.02/AIN0
  Top 0.152: U1.11 40.23,15.04 40.92,14.35 43.05,14.35 43.76,15.06 43.76,17.09 J2.1
P0.03/AIN1
  Top 0.152: U1.9 41.02,15.06 41.43,14.65 42.92,14.65 43.45,15.19 43.45,18.79 J2.2
P0.04/AIN2  (via drill 0.3)
  Top 0.152: U1.20 35.2,13.03 v34.85,13.39
  Bottom 0.152: J2.8 29.13,17.86 31.62,17.86 34.85,14.63 v34.85,13.39
P0.05/AIN3  (via drill 0.3)
  Top 0.152: U1.21 36.96,12.63 37.11,12.78 37.11,14.38 v36.4,15.09
  Bottom 0.152: v36.4,15.09 34.82,15.09 30.86,19.05 J2.7
P0.07  (via drill 0.3)
  Top 0.152: v28.52,10.83 27.6,9.91 R3.2 | U1.23 v37.28,11.83 v37.29,11.84
  Bottom 0.152: v28.52,10.83 28.69,10.83 29.71,11.85 37.27,11.85 v37.29,11.84
P0.08  (via drill 0.3)
  Top 0.152: U1.24 34.65,11.43 v34.53,11.32 | v29.59,9.37 29.59,9.11 R8.1 27.09,8.34 25.9,7.16 J3.3
  Bottom 0.152: v29.59,9.37 30.12,9.91 33.12,9.91 v34.53,11.32
P0.09/NFC1  (via drill 0.3)
  Top 0.152: U1.52 45.02,8.57 v45.3,8.84
  Bottom 0.152: C11.1 42.56,5.49 43.17,5.49 | J7.2 43.18,5.49 43.17,5.49 | 43.17,5.49 43.43,5.75 43.43,8.38 43.89,8.84 v45.3,8.84
P0.10/NFC2
  Top 0.152: U1.54 45.83,7.2 45.85,7.17 45.85,3.94 J7.1
  Bottom 0.152: C10.1 44.45,5.07 45.71,3.81 J7.1
P0.11  (via drill 0.3)
  Top 0.152: U1.27 v37.38,10.23 v37.39,10.24 | v30.35,9.37 R9.1 29.5,7.49 27.18,7.49 26.9,7.22 J3.4
  Bottom 0.152: v37.39,10.24 36.52,9.37 v30.35,9.37
P0.13  (via drill 0.3)
  Top 0.152: U1.37 38.23,6.35 38.1,6.22 36.25,6.22 35.93,5.9 31.59,5.9 v31.37,6.12 | R7.1 21.65,5.95 v21.65,5.8 21.03,5.18 15.32,5.18 14.65,4.51 S3.2
  Bottom 0.152: v31.37,6.12 21.97,6.12 v21.65,5.8
P0.15
  Top 0.152: U1.39 39.02,6.46 38.48,5.92 36.37,5.92 36.05,5.59 30.12,5.59 28.35,3.81 J5.1
P0.17
  Top 0.152: U1.41 39.83,6.39 39.33,5.89 38.89,5.89 38.61,5.61 36.5,5.61 36.17,5.28 30.25,5.28 27.51,2.54 19.05,2.54 J5.2
P0.19
  Top 0.152: U1.42 40.23,7.2 40.25,7.17 40.25,6.38 39.46,5.59 39.02,5.59 38.74,5.31 36.63,5.31 36.3,4.98 31.65,4.98 J7.7
P0.20  (via drill 0.3)
  Top 0.152: U1.44 41.4,6.76 41.4,5.99 40.93,5.52 v40.63,5.52
  Bottom 0.152: v40.63,5.52 40.08,4.98 34.19,4.98 J7.6
P0.21
  Top 0.152: U1.43 41.02,7.24 40.56,6.78 40.56,6.26 39.58,5.28 39.14,5.28 38.84,4.98 36.73,4.98 J7.5
P0.22
  Top 0.152: U1.46 42.23,5.74 41.46,4.98 39.27,4.98 J7.4
P0.23  (via drill 0.3)
  Top 0.152: v40.95,8.44 41.6,8.44 41.83,8.21 U1.45
  Bottom 0.152: v40.95,8.44 40.95,6.57 41.18,6.34 41.18,4.35 J7.3
P0.28/AIN4
  Top 0.152: U1.13 39.1,15.18 36.5,17.78 35.05,17.78 33.78,19.05 J2.6
P0.29/AIN5  (via drill 0.3)
  Top 0.152: U1.10 40.62,16.82 v40.64,16.84
  Bottom 0.152: v40.64,16.84 37.77,16.84 J2.5
P0.30/AIN6
  Top 0.152: U1.14 39.02,18.12 J2.4
P0.31/AIN7
  Top 0.152: U1.12 39.83,18.23 J2.3
SHIELD  (via drill 0.3)
  other vias: 0.56,12.42 0.56,15.21 0.56,17.25 0.56,19.74
  pour Top (isolate 0.152): 0,12.19 5.46,12.19 5.46,20.32 0,20.32
  pour Bottom (isolate 0.152): 0,12.19 5.84,12.19 5.84,20.32 0,20.32
SWDCLK  (via drill 0.3)
  Top 0.152: U1.53 45.42,5.41 v45.32,5.31
  Bottom 0.152: J8.4 38.01,13.43 38.01,14.27 38.74,15 43.42,15 45.24,13.18 45.24,11.33 | 45.24,11.33 J4.2 | v45.32,5.31 46.51,6.5 46.51,10.06 45.24,11.33
SWDIO  (via drill 0.3)
  Top 0.152: U1.51 44.62,6.14 44.5,6.02 v42.88,6.02
  Bottom 0.152: J8.2 39.46,14.7 42.07,14.7 J4.1 42.9,11.53 42.9,6.05 v42.88,6.02
V_BATT  (via drill 0.3)
  Top 0.152: U2.3 19.57,10.16
  Top 0.254: 19.39,10.96 v19.28,11.07 | 7.11,8 7.12,8.01 J1.2
  Top 0.406: 19.39,10.96 U2.3 19.39,8.38 C6.1 | v10.03,8 7.11,8 1.52,8 J12.2 | 19.57,10.16 D4.A
  Bottom 0.254: 19.14,11.07 v19.28,11.07
  Bottom 0.406: v10.03,8 16.07,8 19.14,11.07
V_USB  (via drill 0.3)
  Top 0.152: 6.65,18.18 6.77,18.18
  Top 0.254: 19.39,14.1 C5.1 | U1.32 35.04,7.43 34.62,7.85 v34.62,8.38 | D2.A 6.73,19.04 6.73,18.18
  Top 0.406: J6.VBUS 5.87,17.45 6.6,18.18 6.65,18.18 6.73,18.18 | D3.A 20.57,13.07 v21.23,13.74 20.75,14.22 C5.1 | 6.77,18.18 9.62,18.18 v9.74,18.3 | U2.4 19.39,14.1
  Bottom 0.254: v34.62,8.38 34.57,8.33 26.34,8.33 21.23,13.44 v21.23,13.74
  Bottom 0.406: v21.23,13.74 21.04,13.74 17.94,16.84 12.18,16.84 10.81,18.21 9.84,18.21 v9.74,18.3
VIN  (via drill 0.3)
  Top 0.152: D4.C 22.19,10.16 v22.08,10.04 | v14.84,9.85 14.15,9.15 10.97,9.15 S2.3
  Top 0.254: 26.53,14.92 26.54,14.91
  Top 0.406: D4.C D3.C 22.87,12.72 v23.11,12.97 | U3.1 26.53,14.92 | v24.28,17.08 24.86,16.51 C8.1 26.54,15.79 26.54,14.91 26.54,12.74 26.17,12.37 v24.28,12.37
  Bottom 0.152: v22.08,10.04 21.7,10.04 19.58,12.17 18.43,12.17 16.11,9.85 v14.84,9.85
  Bottom 0.254: v24.28,17.08 24.22,17.14
  Bottom 0.406: v24.28,12.37 23.72,12.37 v23.11,12.97 | J2.12 19.68,17.14 24.22,17.14
VREG_EN  (via drill 0.3)
  Top 0.152: v24.28,13.13 24.39,13.02 U3.3 | S2.2 13.73,12.18 16.54,14.99 21.13,14.99 22.39,13.73 v23.11,13.73
  Bottom 0.152: v23.11,13.73 23.72,13.13 v24.28,13.13
XL1
  Top 0.152: U1.17 35.03,14.63 33.27,16.38 33.27,17.02 | 33.27,17.02 Y1.P$2 | C3.2 31.54,17.02 33.27,17.02
XL2
  Top 0.152: C7.2 33.27,13.55 Y1.P$1 | U1.18 35.19,13.83 34.39,14.63 Y1.P$1 | 33.25,14.63 Y1.P$1

### Text on the board
Bottom: v10
Measures: Units in inches
tDocu: Jim Lindblom